# EasyEDA Pro project ProPrj_Resona_2026-08-17.epro, board ESP32-S3-N16R8
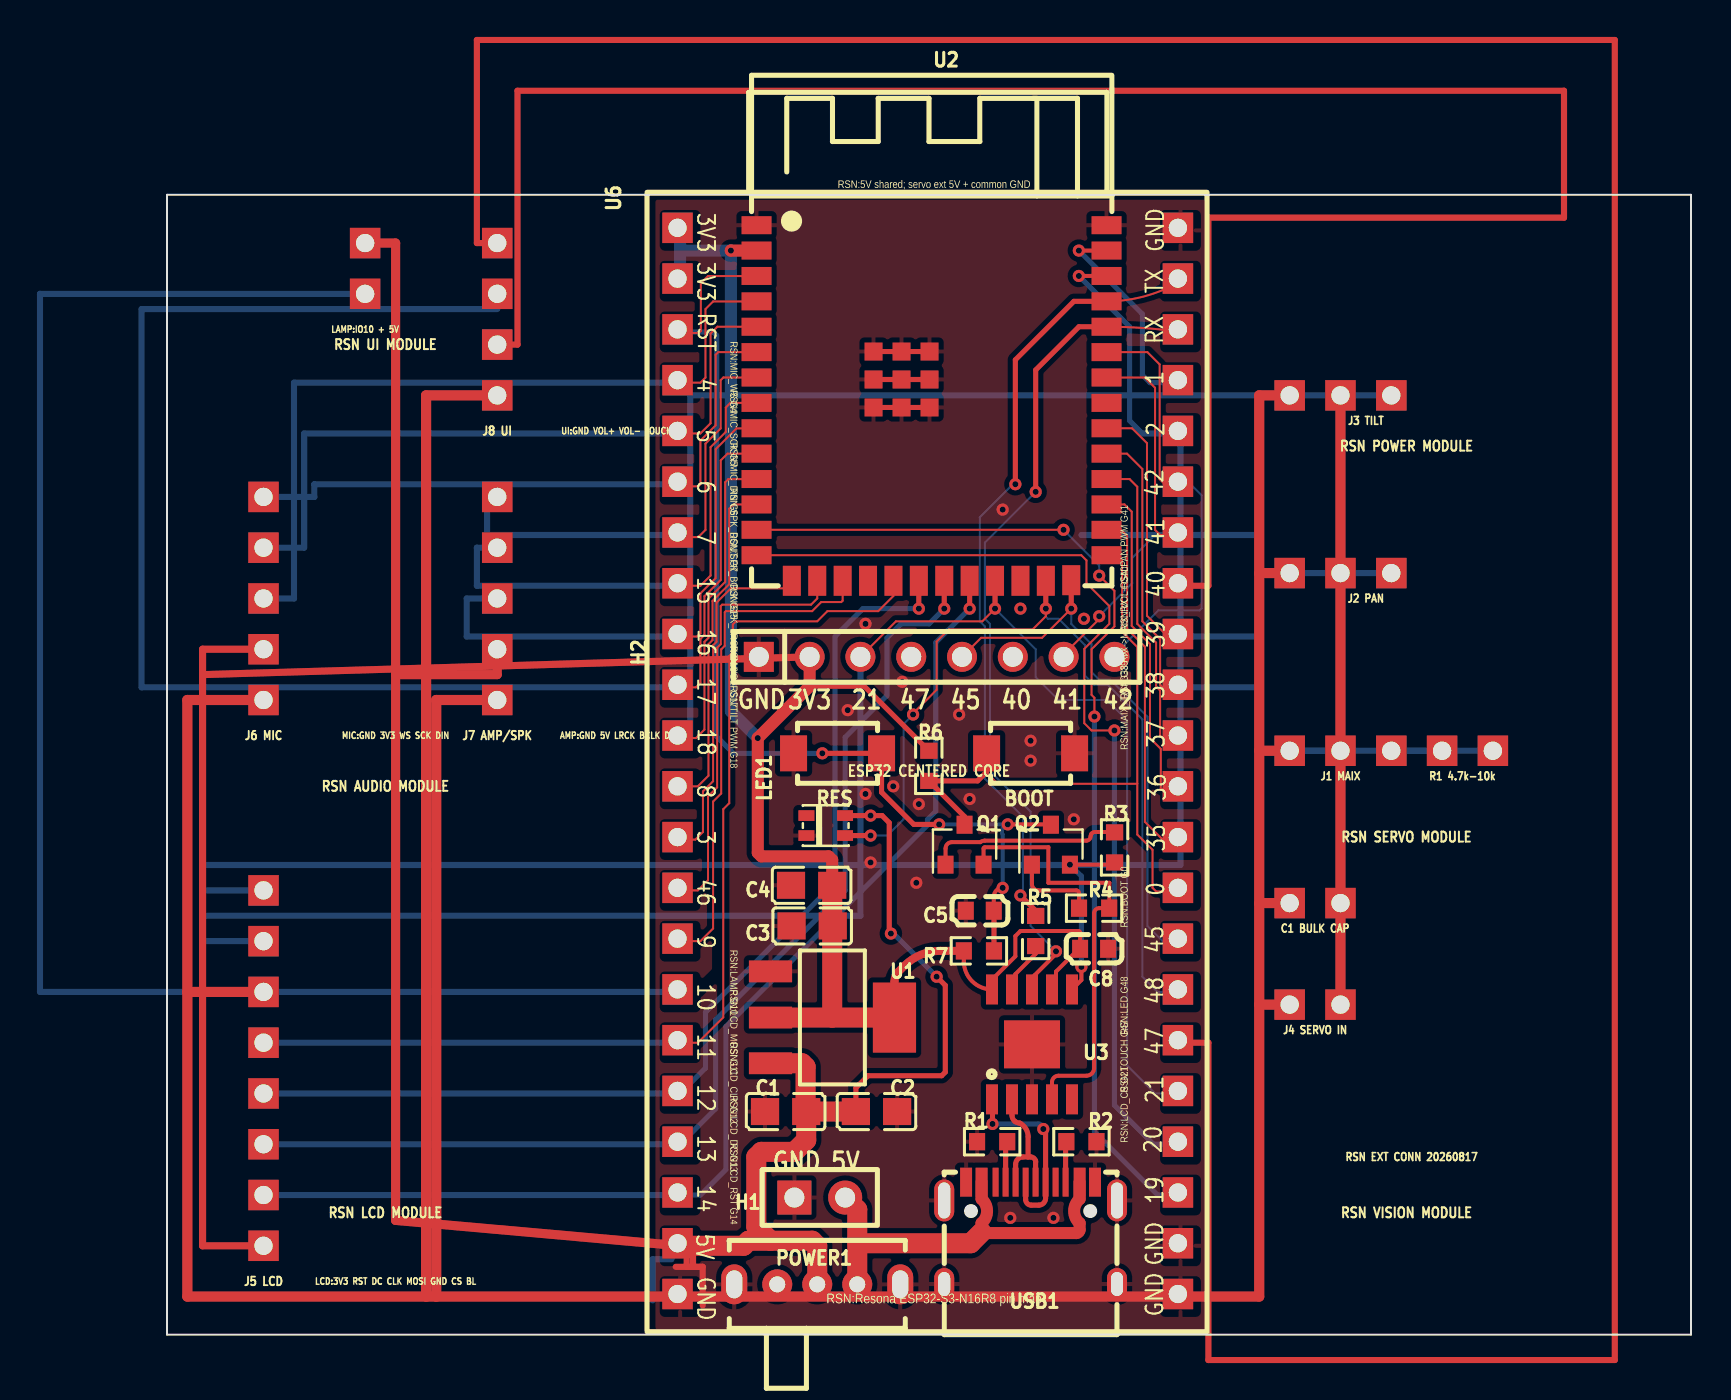
[diagram p0: board, top side]
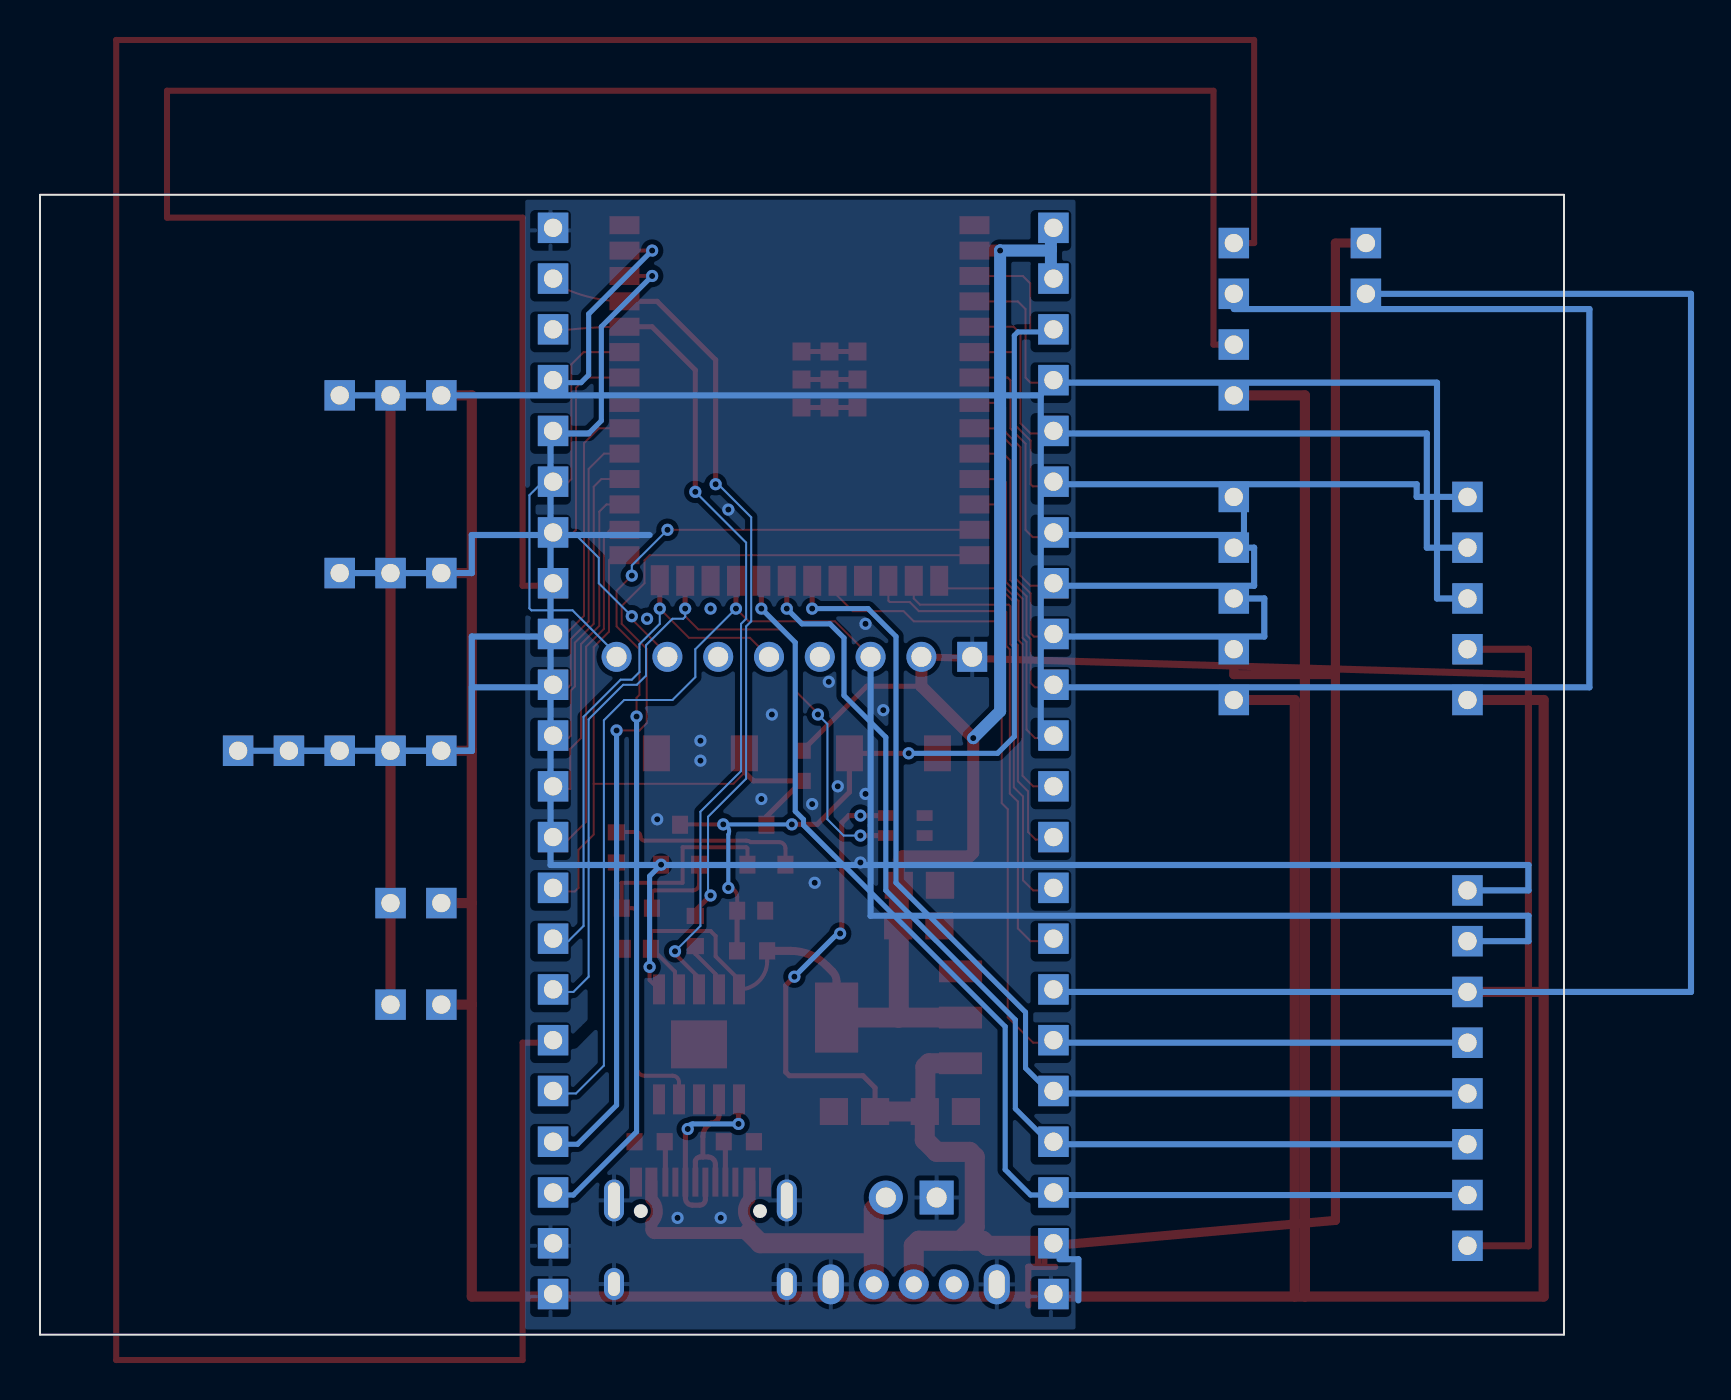
[diagram p1: board, bottom side, seen from below]

Outline 76.2 x 57.02 mm; copper layers: Top Layer, Bottom Layer. Coordinates in mm from the lower left corner of the outline.
Outline path: 0,57.02 0,0 76.2,0 76.2,57.02 0,57.02
Stack: Top Layer 0.035mm / Dielectric1 1.51mm FR4 er 4.5 / Bottom Layer 0.035mm

## Design rules (mm)
spacing copperThickness1oz (default): track to track 0.102, other pairs 0.152 to 0.3
spacing copperThickness2oz: track to track 0.203, other pairs 0.152 to 0.3
spacing Plane_innerPlane: track to track 0.102, other pairs 0.152 to 0.3
spacing Copper_copperRegion: track to track 0.102, other pairs 0.152 to 0.3
track width copperThickness1oz (default): min 0.127, default 0.254, max 2.54
track width copperThickness2oz: min 0.203, default 0.254, max 2.54
differential pair differentialPair (default): width min 0.127, default 0.254, max 2.54; gap min 0.152, default 0.152
pour e559 uses Copper_copperRegion
pour e669 uses Copper_copperRegion

## Placement (name value [footprint] x y rotation side)
BOOT  TS-KG88C-ART25F  [SW-SMD_L4.0-W2.9-LS4.8_G]  43.18 29.08 0 top
C1  10u  [C0805]  30.93 11.16 0 top
C2  104  [C0805]  35.47 11.16 180 top
C3  10u  [C0805]  32.26 20.45 0 top
C4  104  [C0805]  32.23 22.48 0 top
C5  1uF  [C0603]  40.64 21.21 180 top
C8  100nF  [C0603]  46.35 19.3 180 top
H1  -  [HDR-TH_2P-P2.54-V-F]  32.64 6.86 0 top
H2  -  [HDR-TH_8P-P2.54-V-M]  38.48 33.91 0 top
LED1  WS2812-2020  [LED-SMD_L2.2-W2.0]  32.94 25.47 180 top
NOREF  -  [Pad_e915]  56.13 38.1 270 top
NOREF#2  -  [Pad_e912]  61.21 29.21 270 top
NOREF#3  -  [Pad_e920]  61.21 46.99 270 top
NOREF#4  -  [Pad_e987]  16.51 49.53 270 top
NOREF#5  -  [Pad_e985]  16.51 41.91 270 top
NOREF#6  -  [Pad_e976]  4.83 31.75 270 top
NOREF#7  -  [Pad_e974]  4.83 22.22 270 top
NOREF#8  -  [Pad_e991]  9.91 54.61 270 top
NOREF#9  -  [Pad_e918]  56.13 46.99 270 top
NOREF#10  -  [Pad_e967]  4.83 4.44 270 top
NOREF#11  -  [Pad_e981]  16.51 31.75 270 top
NOREF#12  -  [Pad_e984]  16.51 39.37 270 top
NOREF#13  -  [Pad_e970]  4.83 12.06 270 top
NOREF#14  -  [Pad_e910]  56.13 29.21 270 top
NOREF#15  -  [Pad_e968]  4.83 6.98 270 top
NOREF#16  -  [Pad_e982]  16.51 34.29 270 top
NOREF#17  -  [Pad_e989]  16.51 54.61 270 top
NOREF#18  -  [Pad_e973]  4.83 19.69 270 top
NOREF#19  -  [Pad_e969]  4.83 9.53 270 top
NOREF#20  -  [Pad_e977]  4.83 34.29 270 top
NOREF#21  -  [Pad_e913]  63.75 29.21 270 top
NOREF#22  -  [Pad_e990]  9.91 52.07 270 top
NOREF#23  -  [Pad_e919]  58.67 46.99 270 top
NOREF#24  -  [Pad_e917]  61.21 38.1 270 top
NOREF#25  -  [Pad_e909]  58.67 21.59 270 top
NOREF#26  -  [Pad_e988]  16.51 52.07 270 top
NOREF#27  -  [Pad_e907]  58.67 16.51 270 top
NOREF#28  -  [Pad_e986]  16.51 46.99 270 top
NOREF#29  -  [Pad_e911]  58.67 29.21 270 top
NOREF#30  -  [Pad_e914]  66.29 29.21 270 top
NOREF#31  -  [Pad_e978]  4.83 36.83 270 top
NOREF#32  -  [Pad_e908]  56.13 21.59 270 top
NOREF#33  -  [Pad_e972]  4.83 17.14 270 top
NOREF#34  -  [Pad_e906]  56.13 16.51 270 top
NOREF#35  -  [Pad_e979]  4.83 39.37 270 top
NOREF#36  -  [Pad_e983]  16.51 36.83 270 top
NOREF#37  -  [Pad_e980]  4.83 41.91 270 top
NOREF#38  -  [Pad_e916]  58.67 38.1 270 top
NOREF#39  -  [Pad_e971]  4.83 14.61 270 top
POWER1  -  [SK12D07VG3]  32.51 1.02 0 top
Q1  S8050  [SOT-23]  39.88 24.51 90 top
Q2  S8050  [SOT-23]  44.2 24.51 90 top
R1  5.1kΩ  [R0603]  41.26 9.65 180 top
R2  5.1kΩ  [R0603]  45.72 9.65 0 top
R3  4.7kΩ  [R0603]  47.38 24.38 90 top
R4  4.7kΩ  [R0603]  46.35 21.34 180 top
R5  4.7kΩ  [R0603]  43.43 20.19 270 top
R6  10kΩ  [R0603]  38.09 28.46 90 top
R7  10kΩ  [R0603]  40.6 19.2 180 top
RES  TS-KG88C-ART25F  [SW-SMD_L4.0-W2.9-LS4.8_G]  33.53 29.08 180 top
U1  AMS1117-3.3  [SOT-223_L6.5-W3.5-P2.30-LS7.0-BR]  33.27 15.88 180 top
U2  ESP32-S3-WROOM-1-N16  [WIRELM-SMD_ESP32-S3-WROOM-1]  38.23 46.61 0 top
U3  CH340K  [ESOP-10_L4.9-W3.9-P1.00-LS6.2-BL-EP]  43.25 14.52 0 top
U6  -  [ESP32-S3-WROOM-1]  24.13 57.02 270 top
USB1  -  [USB-C-SMD_TYPEC-304-BCP16]  43.18 5.08 0 top

## Footprints (pads in the part's own frame, mm; a bottom-side part is the same pattern mirrored in y, then rotated)
C0603
  rect 0.8x0.9 smd: 1(-0.7,0) 2(0.7,0)
C0805
  rect 1.41x1.35 smd: 1(-1.03,0) 2(1.03,0)
ESOP-10_L4.9-W3.9-P1.00-LS6.2-BL-EP
  rect 0.6x1.5 smd: 1(-2,-2.75) 2(-1,-2.75) 3(0,-2.75) 4(1,-2.75) 5(2,-2.75) 6(2,2.75) 7(1,2.75) 8(0,2.75) 9(-1,2.75) 10(-2,2.75)
  rect 2.8x2.4 smd: 11(0,0)
ESP32-S3-WROOM-1
  rect 1.524x1.524 hole 0.914: 1(1.651,1.397) 2(4.191,1.397) 3(6.731,1.397) 4(9.271,1.397) 5(11.811,1.397) 6(14.351,1.397) 7(16.891,1.397) 8(19.431,1.397) 9(21.971,1.397) 10(24.511,1.397) 11(27.051,1.397) 12(29.591,1.397) 13(32.131,1.397) 14(34.671,1.397) 15(37.211,1.397) 16(39.751,1.397) 17(42.291,1.397) 18(44.831,1.397) 19(47.371,1.397) 20(49.911,1.397) 21(52.451,1.397) 22(54.991,1.397) 23(54.991,26.416) 24(52.451,26.416) 25(49.911,26.416) 26(47.371,26.416) 27(44.831,26.416) 28(42.291,26.416) 29(39.751,26.416) 30(37.211,26.416) 31(34.671,26.416) 32(32.131,26.416) 33(29.591,26.416) 34(27.051,26.416) 35(24.511,26.416) 36(21.971,26.416) 37(19.431,26.416) 38(16.891,26.416) 39(14.351,26.416) 40(11.811,26.416) 41(9.271,26.416) 42(6.731,26.416) 43(4.191,26.416) 44(1.651,26.416)
HDR-TH_2P-P2.54-V-F
  rect 1.7x1.7 hole 1: 1(-1.27,0)
  round 1.7 hole 1: 2(1.27,0)
HDR-TH_8P-P2.54-V-M
  rect 1.5x1.5 hole 1: 1(-8.89,0)
  round 1.5 hole 1: 2(-6.35,0) 3(-3.81,0) 4(-1.27,0) 5(1.27,0) 6(3.81,0) 7(6.35,0) 8(8.89,0)
LED-SMD_L2.2-W2.0
  rect 0.8x0.535 smd: 1(0.965,-0.5) 2(0.965,0.5) 3(-0.965,0.5) 4(-0.965,-0.5)
Pad_e906
  rect 1.524x1.524 hole 0.914: J41(0,0)
Pad_e907
  rect 1.524x1.524 hole 0.914: J42(0,0)
Pad_e908
  rect 1.524x1.524 hole 0.914: C11(0,0)
Pad_e909
  rect 1.524x1.524 hole 0.914: C12(0,0)
Pad_e910
  rect 1.524x1.524 hole 0.914: J11(0,0)
Pad_e911
  rect 1.524x1.524 hole 0.914: J12(0,0)
Pad_e912
  rect 1.524x1.524 hole 0.914: J13(0,0)
Pad_e913
  rect 1.524x1.524 hole 0.914: R11(0,0)
Pad_e914
  rect 1.524x1.524 hole 0.914: R12(0,0)
Pad_e915
  rect 1.524x1.524 hole 0.914: J21(0,0)
Pad_e916
  rect 1.524x1.524 hole 0.914: J22(0,0)
Pad_e917
  rect 1.524x1.524 hole 0.914: J23(0,0)
Pad_e918
  rect 1.524x1.524 hole 0.914: J31(0,0)
Pad_e919
  rect 1.524x1.524 hole 0.914: J32(0,0)
Pad_e920
  rect 1.524x1.524 hole 0.914: J33(0,0)
Pad_e967
  rect 1.524x1.524 hole 0.914: J51(0,0)
Pad_e968
  rect 1.524x1.524 hole 0.914: J52(0,0)
Pad_e969
  rect 1.524x1.524 hole 0.914: J53(0,0)
Pad_e970
  rect 1.524x1.524 hole 0.914: J54(0,0)
Pad_e971
  rect 1.524x1.524 hole 0.914: J55(0,0)
Pad_e972
  rect 1.524x1.524 hole 0.914: J56(0,0)
Pad_e973
  rect 1.524x1.524 hole 0.914: J57(0,0)
Pad_e974
  rect 1.524x1.524 hole 0.914: J58(0,0)
Pad_e976
  rect 1.524x1.524 hole 0.914: J61(0,0)
Pad_e977
  rect 1.524x1.524 hole 0.914: J62(0,0)
Pad_e978
  rect 1.524x1.524 hole 0.914: J63(0,0)
Pad_e979
  rect 1.524x1.524 hole 0.914: J64(0,0)
Pad_e980
  rect 1.524x1.524 hole 0.914: J65(0,0)
Pad_e981
  rect 1.524x1.524 hole 0.914: J71(0,0)
Pad_e982
  rect 1.524x1.524 hole 0.914: J72(0,0)
Pad_e983
  rect 1.524x1.524 hole 0.914: J73(0,0)
Pad_e984
  rect 1.524x1.524 hole 0.914: J74(0,0)
Pad_e985
  rect 1.524x1.524 hole 0.914: J75(0,0)
Pad_e986
  rect 1.524x1.524 hole 0.914: J81(0,0)
Pad_e987
  rect 1.524x1.524 hole 0.914: J82(0,0)
Pad_e988
  rect 1.524x1.524 hole 0.914: J83(0,0)
Pad_e989
  rect 1.524x1.524 hole 0.914: J84(0,0)
Pad_e990
  rect 1.524x1.524 hole 0.914: J85(0,0)
Pad_e991
  rect 1.524x1.524 hole 0.914: J86(0,0)
R0603
  rect 0.806x0.864 smd: 1(-0.753,0) 2(0.753,0)
SK12D07VG3
  round 1.5 hole 0.8: 1(-2,1.5) 2(0,1.5) 3(2,1.5)
  oval 1.3x2 hole 0.8x1.4: 4(4.15,1.5) 5(-4.15,1.5)
SOT-23
  rect 0.9x0.8 smd: 1(-1,0.95) 2(-1,-0.95) 3(1,0)
SOT-223_L6.5-W3.5-P2.30-LS7.0-BR
  rect 2.159x1.092 smd: 1(3.099,-2.299) 2(3.099,0.013) 3(3.099,2.299)
  rect 2.159x3.505 smd: 4(-3.099,0.013)
SW-SMD_L4.0-W2.9-LS4.8_G
  rect 1.35x1.8 smd: 1(-2.2,0) 2(2.2,0)
USB-C-SMD_TYPEC-304-BCP16
  oval 1.001x2.1 hole 0.6x1.801: 13(-4.321,1.633) 14(4.321,1.633)
  oval 1.001x1.6 hole 0.6x1.199: 15(-4.321,-2.547) 16(4.321,-2.547)
  rect 0.6x1.45 smd: A1B12(-3.226,2.547) A4B9(-2.451,2.547) B1A12(3.22,2.547) B4A9(2.451,2.547)
  rect 0.299x1.45 smd: A5(-1.25,2.547) A6(-0.249,2.547) A7(0.249,2.547) A8(1.25,2.547) B5(1.75,2.547) B6(0.75,2.547) B7(-0.75,2.547) B8(-1.75,2.547)
WIRELM-SMD_ESP32-S3-WROOM-1
  rect 1.5x0.9 smd: 1(-8.75,8.895) 2(-8.75,7.625) 3(-8.75,6.355) 4(-8.75,5.085) 5(-8.75,3.815) 6(-8.75,2.545) 7(-8.75,1.275) 8(-8.75,0.005) 9(-8.75,-1.265) 10(-8.75,-2.535) 11(-8.75,-3.805) 12(-8.75,-5.075) 13(-8.75,-6.345) 14(-8.75,-7.615) 27(8.75,-7.615) 28(8.75,-6.345) 29(8.75,-5.075) 30(8.75,-3.805) 31(8.75,-2.535) 32(8.75,-1.265) 33(8.75,0.005) 34(8.75,1.275) 35(8.75,2.545) 36(8.75,3.815) 37(8.75,5.085) 38(8.75,6.355) 39(8.75,7.625) 40(8.75,8.895)
  rect 0.9x1.5 smd: 15(-6.985,-8.895) 16(-5.715,-8.895) 17(-4.445,-8.895) 18(-3.175,-8.895) 19(-1.905,-8.895) 20(-0.635,-8.895) 21(0.635,-8.895) 22(1.905,-8.895) 23(3.175,-8.895) 24(4.445,-8.895) 25(5.715,-8.895) 26(6.985,-8.865)
  rect 0.9x0.9 smd: 41(-2.9,2.575) 41(-2.9,1.175) 41(-2.9,-0.225) 41(-1.5,2.575) 41(-1.5,1.175) 41(-1.5,-0.225) 41(-0.1,2.575) 41(-0.1,1.175) 41(-0.1,-0.225)

## Nets
3V3: C3.2 C4.2 C8.2 H2.2 NOREF#10.J51 NOREF#20.J62 R6.2 R7.2 U1.2 U1.4 U2.2 U3.7 U3.10 U6.1 U6.2
5V: C1.2 C2.2 LED1.4 NOREF#8.J86 NOREF#16.J72 POWER1.2 U1.3 U6.21
5V_SERVO: NOREF#23.J32 NOREF#25.C12 NOREF#27.J42 NOREF#38.J22
GND: BOOT.2 C1.1 C2.1 C3.1 C4.1 C5.2 C8.1 H1.1 H2.1 LED1.2 NOREF.J21 NOREF#6.J61 NOREF#9.J31 NOREF#11.J71 NOREF#14.J11 NOREF#28.J81 NOREF#32.C11 NOREF#33.J56 NOREF#34.J41 POWER1.4 POWER1.5 R1.2 R2.2 RES.2 U1.1 U2.1 U2.40 U2.41 U3.3 U3.11 U6.22 U6.23 U6.24 U6.44 USB1.13 USB1.14 USB1.15 USB1.16 USB1.A1B12 USB1.B1A12
VBUS: H1.2 POWER1.3 USB1.A4B9 USB1.B4A9
340_RX: R5.2 U3.9
340_TX: U2.36 U3.8 U6.42
BOOT: BOOT.1 Q1.3 R6.1 U2.27 U6.31
CC1: R1.1 USB1.A5
CC2: R2.1 USB1.B5
D+: U3.1 USB1.A6 USB1.B6
D-: U3.2 USB1.A7 USB1.B7
DTR: Q1.2 R4.1 U3.4
EN: C5.1 Q2.3 R7.1 RES.1 U2.3 U6.3
IO1: U2.39 U6.41
IO2: NOREF#7.J58 U2.38 U6.40
IO3: U2.15 U6.13
IO4: NOREF#31.J63 U2.4 U6.4
IO5: NOREF#35.J64 U2.5 U6.5
IO6: NOREF#37.J65 U2.6 U6.6
IO7: NOREF#5.J75 U2.7 U6.7
IO8: U2.12 U6.12
IO9: U2.17 U6.15
IO10: NOREF#22.J85 U2.18 U6.16
IO11: NOREF#39.J55 U2.19 U6.17
IO12: NOREF#13.J54 U2.20 U6.18
IO13: NOREF#19.J53 U2.21 U6.19
IO14: NOREF#15.J52 U2.22 U6.20
IO15: NOREF#12.J74 U2.8 U6.8
IO16: NOREF#36.J73 U2.9 U6.9
IO17: NOREF#26.J83 U2.10 U6.10
IO18: NOREF#3.J33 U2.11 U6.11
IO19: U2.13 U6.25
IO20: U2.14 U6.26
IO21: H2.3 NOREF#18.J57 U2.23 U6.27
IO35: U2.28 U6.32
IO36: U2.29 U6.33
IO37: U2.30 U6.34
IO38: NOREF#30.R12 U2.31 U6.35
IO39: NOREF#29.J12 U2.32 U6.36
IO40: H2.6 NOREF#4.J82 U2.33 U6.37
IO41: H2.7 NOREF#24.J23 U2.34 U6.38
IO42: H2.8 U2.35 U6.39
IO45: H2.5 U2.26 U6.30
IO46: U2.16 U6.14
IO47: H2.4 NOREF#17.J84 U2.24 U6.28
IO48: LED1.3 U2.25 U6.29
MAIX_TX_RAW: NOREF#2.J13 NOREF#21.R11
RTS: Q2.2 R3.1 U3.6
U0TX: R5.1 U2.37 U6.43
$1N1380: Q2.1 R4.2
$1N1381: Q1.1 R3.2

Pads without a net: LED1 1; POWER1 1; U3 5; USB1 A8 B8

## Via types
v1: diameter 0.61, hole 0.305, Top Layer to Bottom Layer, 50 vias

## Routing (per net, layer and track width the routed paths; a pad name or vN(x,y) marks a point on that pad's centre or on a via; arc(x,y) is an arc through that point)
3V3: length 152.4
  Top Layer w0.2: U3.7 44.45,17.47 44.45,18.16 45.59,19.3 C8.2 45.66,20.13 45.59,20.19 42.67,20.19 42.42,19.94 42.42,18.93 41.25,17.76 U3.10 arc(40.25,17.68) 39.84,18.68 R7.2
  Top Layer w0.254: R6.2 34.86,32.44 32.13,32.44
  Top Layer w0.355: NOREF#20.J62 1.78,34.29 1.78,33.02 ; NOREF#10.J51 1.78,4.44 1.78,33.02 ; 1.78,33.02 H2.2
  Top Layer w0.4: U1.4 36.37,17.67 arc(36.43,17.94) 36.58,18.16 36.87,18.45 arc(37.69,19.01) 38.67,19.2 R7.2
  Top Layer w0.6: U2.2 v1(28.19,54.23) ; H2.2 32.13,32.44 v1(29.54,29.84) 29.54,24.11 29.72,23.93 33.08,23.93 33.26,23.75 C4.2
  Top Layer w1: 30.17,15.86 33.26,15.86 ; 33.26,15.86 C4.2 ; 33.26,15.86 U1.4
  Bottom Layer w0.6: 25.65,54.31 25.65,52.7 ; 25.65,54.31 25.73,54.23 v1(28.19,54.23) 28.19,31.19 v1(29.54,29.84) ; 25.65,54.31 25.65,55.25
5V: length 117.2
  Top Layer w0.254: LED1.4 v1(35.18,25.97) 35.75,25.97 36.11,25.61 36.11,20.15 v1(36.19,20.07) ; C2.2 34.44,12.35 35.05,12.95 38.73,12.95 38.91,13.13 38.91,17.47 v1(38.48,17.91)
  Top Layer w0.457: 25.65,4.44 11.43,5.72 11.43,33.02 ; 11.43,33.02 11.43,54.61 NOREF#8.J86 ; 11.43,33.02 16.51,33.02 NOREF#16.J72
  Top Layer w1: 30.17,4.7 29.46,5.41 29.46,8.89 29.72,9.14 31.37,9.14 31.96,9.73 C1.2 C2.2 ; 30.17,4.7 29.08,4.7 28.83,4.44 25.65,4.44 ; 30.17,4.7 32.26,4.7 32.51,4.44 POWER1.2 ; 30.17,13.58 31.75,13.58 31.93,13.4 31.93,11.5 32,11.43
  Bottom Layer w0.254: v1(38.48,17.91) 36.32,20.07 v1(36.19,20.07)
5V_SERVO: length 30.5
  Top Layer w0.508: NOREF#27.J42 NOREF#25.C12 NOREF#38.J22 NOREF#23.J32
GND: length 233.7
  Top Layer w0.254: U2.41 U2.41 U2.41 ; U2.41 U2.41 U2.41 ; U2.41 U2.41 U2.41
  Top Layer w0.508: 13.46,1.91 13.46,31.75 NOREF#11.J71 ; 13.46,1.91 12.95,1.91 ; 13.46,1.91 54.61,1.91 54.61,16.51 ; 54.61,29.21 54.61,38.1 ; 54.61,29.21 NOREF#14.J11 ; 54.61,29.21 54.61,21.59 ; 54.61,38.1 54.61,46.99 NOREF#9.J31 ; 54.61,38.1 NOREF.J21 ; 12.95,1.91 12.95,46.99 NOREF#28.J81 ; 12.95,1.91 1.02,1.91 1.02,17.14 ; 54.61,16.51 54.61,21.59 ; 54.61,16.51 NOREF#34.J41 ; 54.61,21.59 NOREF#32.C11 ; 1.02,17.14 NOREF#33.J56 ; 1.02,17.14 1.02,31.75 NOREF#6.J61
  vias: v1(34.04,31.24) v1(34.92,35.56) v1(34.92,27.05) v1(35.18,23.62) v1(36.31,27.43) v1(36.76,32.66) v1(37.47,22.61) v1(37.59,26.54) v1(39.61,31.02) v1(40.13,26.8) v1(41.78,41.28) v1(42.16,5.84) v1(43.18,29.71) v1(43.18,28.72) v1(44.32,5.84) v1(45.34,25.78)
VBUS: length 21.2
  Top Layer w0.6: USB1.A4B9 40.73,6.79 arc(41,6.18) 40.73,5.58 40.73,5.12 arc(40.74,5.09) 40.77,5.08 45.47,5.08 arc(45.58,5.13) 45.63,5.25 45.63,5.58 arc(45.36,6.18) 45.63,6.79 USB1.B4A9
  Top Layer w1: POWER1.3 34.51,6.25 H1.2 ; 34.53,4.57 40.18,4.57 40.73,5.12
340_RX: length 2.7
  Top Layer w0.2: U3.9 42.42,17.44 42.42,18.03 43.43,19.05 R5.2
340_TX: length 42.2
  Top Layer w0.1: U2.36 arc(48.83,50.36) 50.67,50.17
  Top Layer w0.2: v1(44.45,19.18) 44.45,19.05 43.38,17.98 43.38,17.4 U3.8
  Top Layer w0.254: U2.36 45.6,50.42 43.43,48.26 v1(43.43,42.16)
  Bottom Layer w0.1: v1(44.45,19.18) 43.18,20.45 43.18,26.16 41.15,28.19 41.15,35.56 40.89,35.81 40.89,39.62 v1(43.43,42.16)
BOOT: length 34.1
  Top Layer w0.1: 48.51,27.56 48.51,34.4 47.75,35.17 47.75,38.73 47.49,38.99 U2.27 ; 48.51,27.56 41.53,27.56 40.98,28.11 ; 48.51,27.56 48.51,25.02 49.28,24.26 49.28,22.35 49.46,22.17 50.62,22.17 50.67,22.22
  Top Layer w0.254: Q1.3 39.88,25.92 R6.1 40.53,27.7 40.98,28.15 BOOT.1
CC1: length 2.1
  Top Layer w0.254: USB1.A5 41.93,9.57 arc(41.95,9.63) R1.1
CC2: length 2
  Top Layer w0.254: USB1.B5 44.93,9.62 arc(44.94,9.64) R2.1
D+: length 9.7
  Top Layer w0.254: v1(41.28,10.54) 41.28,11.75 arc(41.27,11.76) U3.1 ; 42.93,7.63 42.93,6.76 arc(43.01,6.56) 43.22,6.48 43.58,6.48 arc(43.83,6.58) 43.93,6.82 USB1.B6 43.93,10.17 arc(43.9,10.25) v1(43.81,10.29)
  Bottom Layer w0.254: v1(41.28,10.54) 43.56,10.54 arc(43.74,10.47) v1(43.81,10.29)
D-: length 6.6
  Top Layer w0.254: 43.06,8.89 42.8,8.89 arc(42.54,8.78) 42.43,8.52 USB1.B7 ; 43.06,8.89 43.18,8.89 arc(43.34,8.83) 43.43,8.69 ; 43.06,8.89 43.06,9.9 arc(42.94,10.3) 42.64,10.59 arc(42.52,10.6) 42.41,10.66 arc(42.29,10.8) 42.25,10.97 U3.2 ; USB1.A7 43.43,8.69 ; 43.43,8.69 arc(43.43,8.66) 43.43,8.64
DTR: length 22.2
  Top Layer w0.2: U3.4 44.25,12.63 arc(44.35,12.86) 44.58,12.95 45.97,12.95 arc(46.24,13.07) 46.35,13.33 46.35,21.08 arc(46.43,21.26) 46.61,21.34 R4.1 arc(47.11,21.34) 47.12,21.34 47.12,22.61 44.07,22.61 44.07,24.38 40.89,24.38 arc(40.85,24.36) 40.83,24.32 Q1.2
EN: length 54.8
  Top Layer w0.1: U2.3 29.47,52.96 27.05,52.96 26.69,52.6 26.69,50.21 26.59,50.11 25.71,50.11 25.65,50.17
  Top Layer w0.2: C5.1 41.34,21.91 arc(41.47,22.22) v1(41.78,22.35) ; v1(42.04,25.53) 44.18,25.53 arc(44.19,25.52) Q2.3
  Top Layer w0.254: 41.35,19.2 41.35,21.2 arc(41.35,21.21) C5.1 ; v1(38.61,25.53) 37.34,25.53 35.73,27.14 RES.1 v1(32.77,29.08)
  Bottom Layer w0.2: v1(41.78,22.35) 41.78,25.02 arc(41.78,25.34) v1(42.04,25.53) v1(38.61,25.53)
  Bottom Layer w0.254: 25.65,50.17 27.31,50.17 27.48,49.99 27.48,29.92 28.32,29.08 v1(32.77,29.08)
IO1: length 11
  Top Layer w0.2: U2.39 v1(45.59,54.23)
  Bottom Layer w0.254: 50.67,47.62 49.15,47.62 48.77,48.01 48.77,51.06 v1(45.59,54.23)
IO2: length 87.3
  Top Layer w0.2: U2.38 v1(45.59,52.96)
  Bottom Layer w0.254: v1(45.59,52.96) 48.13,50.42 48.13,45.72 48.77,45.08
  Bottom Layer w0.305: 48.77,45.08 50.67,45.08 50.67,23.5 1.78,23.5 1.78,22.22 NOREF#7.J58
IO3: length 17.3
  Top Layer w0.1: 25.65,24.77 26.42,24.77 26.8,25.15 26.8,27.18 27.31,27.69 27.31,34.49 27.48,34.66 27.48,36.62 28.19,37.34 30.87,37.34 U2.15
IO4: length 39.1
  Top Layer w0.1: 25.65,47.62 26.67,47.62 26.92,47.88 26.92,51.31 27.31,51.69 29.47,51.69 U2.4
  Bottom Layer w0.305: NOREF#31.J63 6.35,36.83 6.35,47.62 25.65,47.62
IO5: length 35.2
  Top Layer w0.1: U2.5 27.52,50.42 27.18,50.08 27.18,45.59 26.67,45.08 25.65,45.08
  Bottom Layer w0.305: NOREF#35.J64 6.86,39.37 6.86,45.08 25.65,45.08
IO6: length 31.5
  Top Layer w0.1: U2.6 27.56,49.15 27.43,49.02 27.43,45.49 26.67,44.73 26.67,42.55 26.56,42.44 25.76,42.44 25.65,42.55
  Bottom Layer w0.305: NOREF#37.J65 7.37,41.91 7.37,42.55 25.65,42.55
IO7: length 23.2
  Top Layer w0.1: U2.7 27.82,47.88 27.68,47.75 27.68,45.33 26.92,44.58 26.92,40.26 26.56,39.9 25.76,39.9 25.65,40
  Bottom Layer w0.305: NOREF#5.J75 16,41.91 16,40 25.65,40
IO8: length 16.9
  Top Layer w0.1: U2.12 28.33,41.53 28.11,41.32 28.11,37.54 27.28,36.71 27.28,34.75 27.07,34.54 27.07,27.96 26.54,27.43 25.78,27.43 25.65,27.31
IO9: length 25.1
  Top Layer w0.1: 25.65,19.69 26.67,19.69 27.31,20.32 27.31,26.67 27.71,27.07 27.71,34.28 27.89,34.46 27.89,36.14 27.94,36.19 32.26,36.19 32.71,36.65 33.71,36.65 33.78,36.72 U2.17
IO10: length 86.2
  Bottom Layer w0.305: NOREF#22.J85 -6.35,52.07 -6.35,17.14 25.65,17.14 ; 24.28,1.71 24.28,3.77 25.22,3.77
IO11: length 52.7
  Top Layer w0.1: U2.19 36.32,36.96 35.56,36.19 33.02,36.19 32.51,35.69 28.45,35.69 28.29,35.53 28.29,34.13 28.11,33.95 28.11,26.59 27.81,26.29 27.81,15.88 26.54,14.61 25.65,14.61
  Bottom Layer w0.305: 25.65,14.61 NOREF#39.J55
IO12: length 53.1
  Top Layer w0.254: U2.20 v1(37.59,36.32)
  Bottom Layer w0.254: v1(37.59,36.32) 34.8,36.32 33.4,34.92 33.4,22.61 26.92,16.13 26.92,13.33 25.65,12.06
  Bottom Layer w0.305: 25.65,12.06 NOREF#13.J54
IO13: length 55.3
  Top Layer w0.254: U2.21 v1(38.86,36.32)
  Bottom Layer w0.254: 25.65,9.53 27.43,11.3 27.43,15.75 33.91,22.22 33.91,29.89 36,31.98 36,34.86 36.7,35.56 38.1,35.56 v1(38.86,36.32)
  Bottom Layer w0.305: 25.65,9.53 NOREF#19.J53
IO14: length 58.1
  Top Layer w0.254: U2.22 v1(40.13,36.32)
  Bottom Layer w0.254: 25.65,6.98 26.67,6.98 27.94,8.25 27.94,15.41 38.02,25.49 38.02,25.77 38.44,26.18 38.44,34.63 v1(40.13,36.32)
  Bottom Layer w0.305: 25.65,6.98 NOREF#15.J52
IO15: length 25.2
  Top Layer w0.1: U2.8 28.17,46.61 27.94,46.38 27.94,45.16 27.18,44.4 27.18,37.97 26.67,37.47 25.65,37.47
  Bottom Layer w0.305: NOREF#12.J74 15.49,39.37 15.49,37.47 25.65,37.47
IO16: length 27.2
  Top Layer w0.1: 25.65,34.92 26.51,34.92 26.67,35.09 26.67,37.08 27.43,37.85 27.43,44.3 28.47,45.34 29.47,45.34 U2.9
  Bottom Layer w0.305: 25.65,34.92 14.99,34.92 14.99,36.83 NOREF#36.J73
IO17: length 78.2
  Top Layer w0.1: U2.10 28.02,44.07 27.69,43.74 27.69,37.75 26.87,36.94 26.87,35 26.67,34.8 26.67,32.61 26.45,32.39 25.65,32.39
  Bottom Layer w0.305: 16.51,51.31 -1.27,51.31 -1.27,32.39 25.65,32.39
IO18: length 68.5
  Top Layer w0.1: 25.65,29.84 26.45,29.84 26.87,30.27 26.87,34.66 27.07,34.86 27.07,36.82 27.91,37.65 27.91,42.64 28.07,42.8 29.47,42.8 U2.11
  Bottom Layer w0.305: NOREF#3.J33 26.16,46.99 26.16,29.84 25.65,29.84
IO19: length 52.7
  Top Layer w0.1: v1(46.37,30.92) 46.37,31.86 46.23,32 46.23,34.29 47.37,35.43 47.37,37.21 v1(46.61,37.97) ; U2.13 v1(44.83,40.26)
  Bottom Layer w0.1: v1(44.83,40.26) 46.61,38.48 v1(46.61,37.97)
  Bottom Layer w0.254: v1(46.37,30.92) 46.37,10.15 49.53,6.98 50.67,6.98
IO20: length 50.3
  Top Layer w0.1: v1(47.37,30.23) 46.23,30.23 45.86,30.59 45.86,34.31 47.12,35.56 47.12,36.45 45.97,37.59 45.97,38.73 45.72,38.99 U2.14
  Bottom Layer w0.254: 50.67,9.53 49.32,9.53 47.37,11.48 v1(47.37,30.23)
IO21: length 89.5
  Top Layer w0.1: v1(41.4,36.32) 40.77,35.69 36.45,35.69 H2.3
  Top Layer w0.254: U2.23 v1(41.4,36.32)
  Bottom Layer w0.1: v1(41.4,36.32) 43.43,34.29 43.43,32.89 44.58,31.75 46.99,31.75 48.01,30.73 48.01,13.46 49.4,12.06 50.67,12.06
  Bottom Layer w0.305: NOREF#18.J57 1.78,19.69 1.78,20.95 34.67,20.95 H2.3
IO35: length 18
  Top Layer w0.1: U2.28 47.7,40.26 48.01,39.95 48.01,35.31 48.89,34.42 48.89,25.65 49.78,24.77 50.67,24.77
IO36: length 16.9
  Top Layer w0.1: 50.67,27.31 49.69,27.31 49.69,29.31 49.15,29.84 49.15,34.54 48.23,35.46 48.23,41.17 47.87,41.53 U2.29
IO37: length 15.7
  Top Layer w0.1: U2.30 48.13,42.8 48.51,42.42 48.51,35.56 49.45,34.62 49.45,32.43 49.66,32.23 49.66,29.96 49.78,29.84 50.67,29.84
IO38: length 33.1
  Top Layer w0.1: 50.67,32.39 49.78,32.39 49.66,32.51 49.66,34.8 48.77,35.69 48.77,43.31 48,44.07 U2.31
  Bottom Layer w0.305: 50.67,32.39 54.61,32.39 54.61,29.21 NOREF#30.R12
IO39: length 26.8
  Top Layer w0.1: U2.32 48.25,45.34 49,44.6 49,35.96 50.04,34.92 50.67,34.92
  Bottom Layer w0.305: NOREF#29.J12 54.61,29.21 54.61,34.92 50.67,34.92
IO40: length 112.2
  Top Layer w0.305: 26.78,3.39 26.3,3.39 ; 26.3,3.39 26.3,4.66 26.41,4.66 ; 26.3,3.39 25.95,3.39 ; NOREF#4.J82 17.53,49.53 17.53,62.23 69.85,62.23 69.85,55.88 52.07,55.88 52.07,37.47 50.67,37.47
  vias: v1(45.85,35.81)
IO41: length 36.5
  Top Layer w0.1: H2.7 44.83,34.02 46.61,35.8 v1(46.61,35.94) ; 50.67,40 49.66,40 49.4,40.26 49.4,47.37 48.89,47.88 U2.34
  Bottom Layer w0.1: v1(46.61,35.94) 48.26,37.59 48.26,38.86 49.4,40
  Bottom Layer w0.305: 45.72,40 54.61,40 54.61,38.1 NOREF#24.J23
IO42: length 22.2
  Top Layer w0.1: 50.67,42.55 49.89,42.55 49.63,42.8 49.63,48.54 49.02,49.15 U2.35
  Bottom Layer w0.1: 50.67,42.55 51.18,42.55 51.73,42 51.73,36.34 51.63,36.24 49.57,36.24 47.37,34.04 H2.8
IO45: length 27.6
  Top Layer w0.1: v1(45.21,36.32) 43.75,34.86 40.7,34.86 H2.5
  Top Layer w0.254: U2.26 v1(45.21,36.32)
  Bottom Layer w0.1: 50.67,19.69 49.78,19.69 49.02,20.45 49.02,30.91 47.17,32.77 46.61,32.77 46.23,33.15 46.23,34.54 45.21,35.56 v1(45.21,36.32)
IO46: length 21.5
  Top Layer w0.1: U2.16 32.51,36.83 32.2,36.52 27.76,36.52 27.69,36.45 27.69,34.54 27.51,34.36 27.51,27.38 27.05,26.92 27.05,22.73 26.54,22.22 25.65,22.22
IO47: length 175.4
  Top Layer w0.305: 25.98,3.39 25.98,3.77 ; 25.98,3.39 25.44,3.39 ; 25.98,3.39 26.78,3.39 26.78,1.46 ; 50.67,14.61 52.07,14.61 52.07,-1.27 72.39,-1.27 72.39,64.77 15.49,64.77 15.49,54.61 NOREF#17.J84
  vias: v1(42.67,36.32)
IO48: length 43.9
  Top Layer w0.1: v1(43.94,36.32) 43.94,35.94 43.28,35.28 39.09,35.28 38.48,34.67 38.48,32.26 37.3,31.08 v1(37.3,31.02)
  Top Layer w0.254: U2.25 v1(43.94,36.32) ; LED1.3 v1(35.18,24.97)
  Bottom Layer w0.1: v1(43.94,36.32) 43.94,35.91 44.04,35.81 44.58,35.81 45.9,34.49 45.9,32.97 46.35,32.51 47.04,32.51 48.77,30.78 48.77,17.91 49.53,17.14 50.67,17.14 ; v1(35.18,24.97) 36.02,24.97 36.83,25.78 36.83,30.55 v1(37.3,31.02)
MAIX_TX_RAW: length 2.5
  Bottom Layer w0.305: NOREF#2.J13 NOREF#21.R11
RTS: length 8.8
  Top Layer w0.2: U3.6 45.72,17.74 v1(45.72,18.4) ; v1(45.15,23.51) 47.27,23.51
  Bottom Layer w0.254: v1(45.15,23.51) 45.72,22.94 v1(45.72,18.4)
U0TX: length 39.5
  Top Layer w0.1: U2.37 arc(48.89,51.95) 50.67,52.7
  Top Layer w0.254: v1(42.42,42.55) 42.42,48.77 45.34,51.69 U2.37 ; R5.1 43.43,21.21 v1(42.67,21.97)
  Bottom Layer w0.1: v1(42.67,21.97) 42.8,22.1 42.8,25.91 40.89,27.81 40.89,35.43 40.64,35.69 40.64,40.89 42.29,42.55 v1(42.42,42.55)
$1N1380: length 4.3
  Top Layer w0.2: Q2.1 43.25,22.54 arc(43.34,22.32) 43.56,22.22 45.47,22.22 arc(45.56,22.19) 45.6,22.09 R4.2
$1N1381: length 9.7
  Top Layer w0.2: Q1.1 38.93,24.32 arc(39.02,24.55) 39.24,24.64 40.66,24.64 arc(40.77,24.69) 40.89,24.71 45.96,24.71 arc(46.12,24.78) 46.18,24.93 arc(46.19,24.99) 46.22,25.06 arc(46.3,25.12) 46.4,25.15 47.36,25.15 arc(47.37,25.14) R3.2

## Copper pours and planes (outline as drawn; the poured copper is in the pictures)
GND on Top Layer: 11.81,57.91 52.32,57.91 52.32,-3.81 11.81,-3.81
GND on Bottom Layer: 20.19,57.02 59.18,57.02 59.18,-0.13 20.19,-0.13

## Text on the board
Top Silkscreen Layer: LAMP:IO10 + 5V | MIC:GND 3V3 WS SCK DIN | LCD:3V3 RST DC CLK MOSI GND CS BL | UI:GND VOL+ VOL- TOUCH | AMP:GND 5V LRCK BCLK DIN | C1 BULK CAP | J4 SERVO IN | J1 MAIX | J3 TILT | J2 PAN | RSN EXT CONN 20260817 | R1 4.7k-10k | J6 MIC | J5 LCD | J8 UI | J7 AMP/SPK | RSN UI MODULE | RSN AUDIO MODULE | RSN LCD MODULE | RSN POWER MODULE | RSN SERVO MODULE | RSN VISION MODULE | ESP32 CENTERED CORE | 20 | TX | RX | 1 | 42 | 45 | 48 | 47 | 21 | GND | 19 | 2 | 41 | 38 | 0 | 37 | 40 | 39 | 35 | 36 | 5V | 5 | 15 | 8 | 3V3 | 4 | 6 | 7 | 17 | 3 | 46 | 9 | 10 | 11 | 12 | 13 | 14 | 16 | 18 | RST | RSN:PAN PWM G41 | RSN:VOL+ G40 | RSN:G39 TX->MAIX_RX | RSN:MAIX_TX->G38 RX | RSN:BOOT G0 | RSN:LED G48 | RSN:TOUCH G47 | RSN:LCD_CS G21 | RSN:MIC_WS G4 | RSN:MIC_SCK G5 | RSN:MIC_DIN G6 | RSN:SPK_DOUT G7 | RSN:SPK_BCLK G15 | RSN:SPK_LRCK G16 | RSN:VOL- G17 | RSN:TILT PWM G18 | RSN:LAMP G10 | RSN:LCD_MOSI G11 | RSN:LCD_CLK G12 | RSN:LCD_DC G13 | RSN:LCD_RST G14 | RSN:5V shared; servo ext 5V + common GND | RSN:Resona ESP32-S3-N16R8 pin map
